# Altium schematic sheet DXES101B-659637-RELAYS.SchDoc
size A3; Organization: Altium Limited; Address1: 3 Minna Close; Address2: Belrose; Address3: NSW 2085; Address4: Australia; SheetNumber: 4; SheetTotal: 10
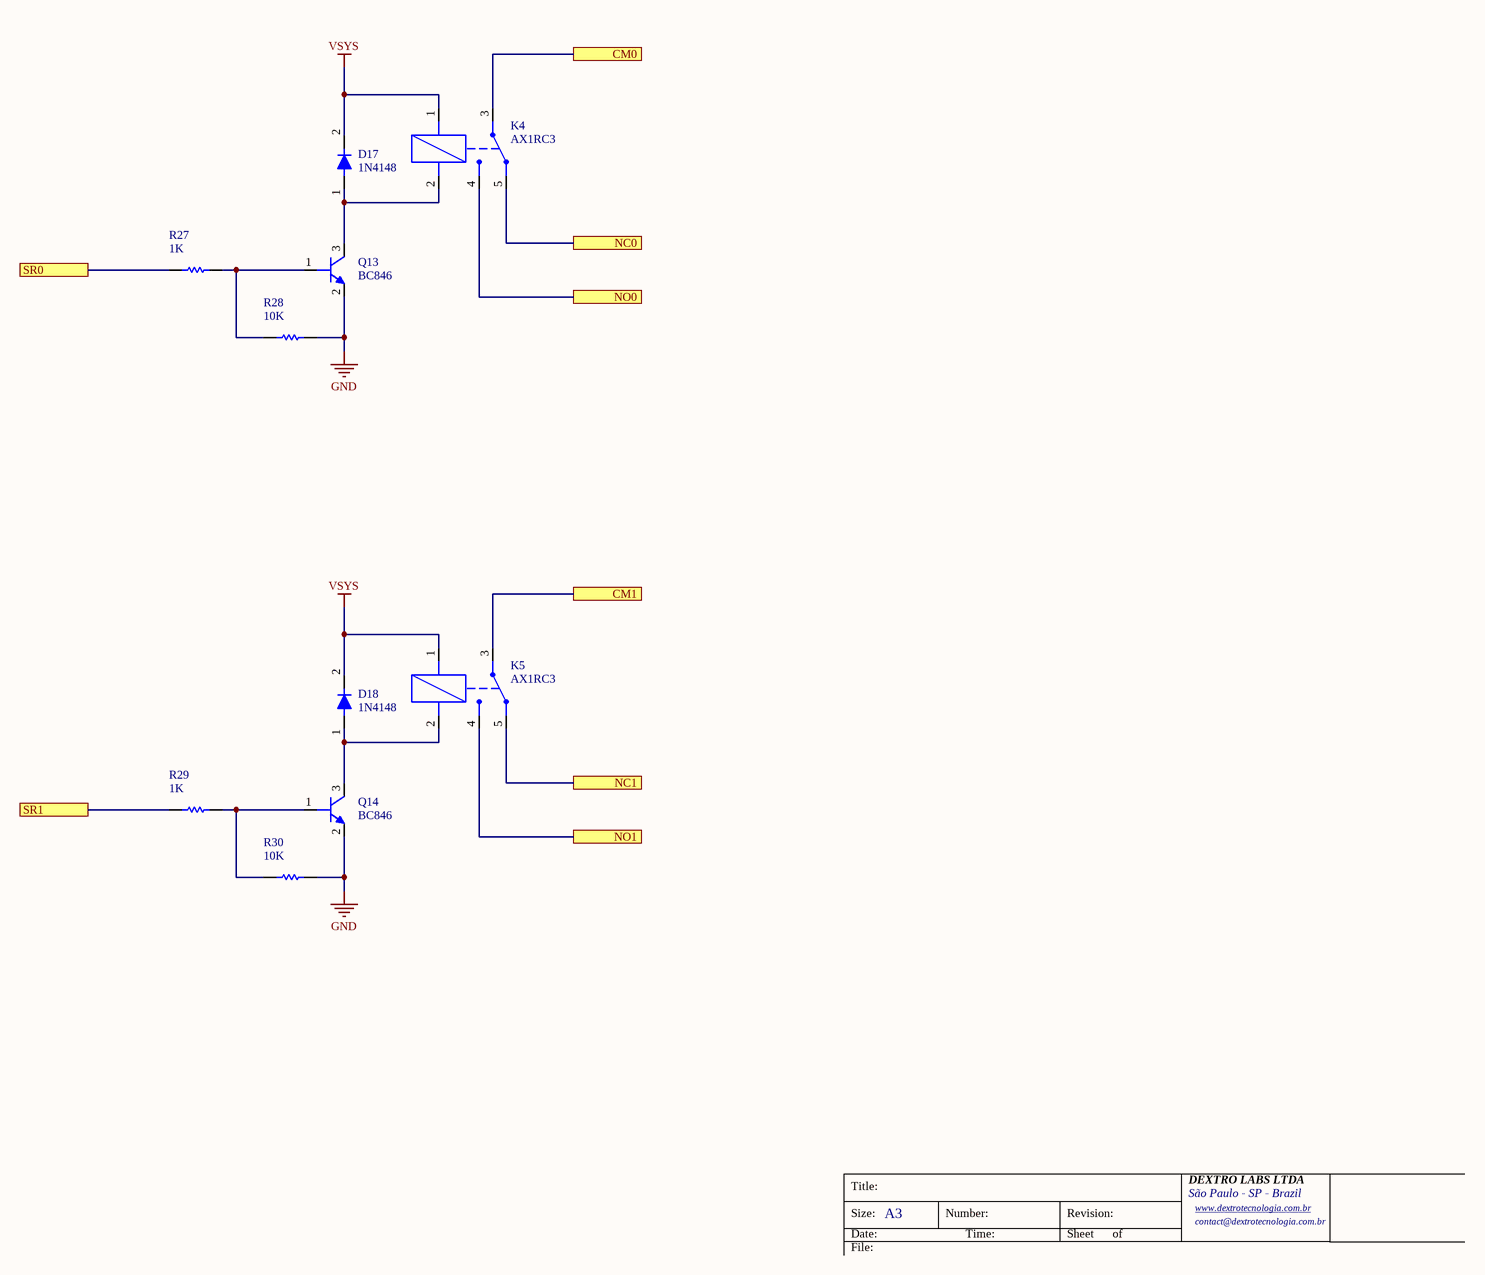
[diagram p0: DXES101B-659637-RELAYS.SchDoc]

## Parts
D17  1N4148  [SOD123]
D18  1N4148  [SOD123]
K4  AX1RC3  [AX1RCX]
K5  AX1RC3  [AX1RCX]
Q13  BC846  [SOT23-3]
Q14  BC846  [SOT23-3]
R27  1K  [RES-0603]
R28  10K  [RES-0603]
R29  1K  [RES-0603]
R30  10K  [RES-0603]

## Ports
CM0 (see DXES101B-659637-GENERAL[4A]), CM1 (see DXES101B-659637-GENERAL[4B]), NC0 (see DXES101B-659637-GENERAL[4A]), NC1 (see DXES101B-659637-GENERAL[4A]), NO0 (see DXES101B-659637-GENERAL[4A]), NO1 (see DXES101B-659637-GENERAL[4B]), SR0 (see DXES101B-659637-GENERAL[3A], DXES101B-659637-POWER-AND-SIGNALS[2C]), SR1 (see DXES101B-659637-GENERAL[3A], DXES101B-659637-POWER-AND-SIGNALS[3C])

## Nets
GND: Q13.2 Q14.2 R28.2 R30.2
VSYS: D17.2(K) D18.2(K) K4.1 K5.1
CM0: K4.3 ; port CM0
CM1: K5.3 ; port CM1
NC0: K4.5 ; port NC0
NC1: K5.5 ; port NC1
NO0: K4.4 ; port NO0
NO1: K5.4 ; port NO1
SR0: R27.1 ; port SR0
SR1: R29.1 ; port SR1
NetD17_1: D17.1(A1) K4.2 Q13.3
NetD18_1: D18.1(A1) K5.2 Q14.3
NetQ13_1: Q13.1 R27.2 R28.1
NetQ14_1: Q14.1 R29.2 R30.1

## Notes on the sheet
- Title:
- Size:
- Date:
- A3
- Number:
- Time:
- Revision:
- Sheet
- of
- DEXTRO LABS LTDA
- São Paulo - SP - Brazil
- www.dextrotecnologia.com.br <http://www.dextrotecnologia.com.br>
- contact@dextrotecnologia.com.br
- File:

## Library data of the parts
D17 D18 = 1N4148: 1A 4ns 75V Independent 1V@50mA 150mA SOD-123 Single Diodes RoHS
K4 K5 = AX1RC3: RELÉ-METALTEX-BOBINA 24V-15A-SPDT
Q13 Q14 = TRANSISTOR-BC846B,215-SOT23: 65V 200@10mA,5V 250mW 100mA NPN SOT-23 Bipolar (BJT) ROHS; LCSC: C87062
R27 R29 = RES-1K-1%-100mW-0603: 100mW Thick Film Resistor 75V ±100ppm/℃ ±1% 1kΩ 0603 Chip Resistor - Surface Mount ROHS; LCSC: C22548
R28 R30 = RES-10K-1%-100mW-0603: 100mW Thick Film Resistor 75V ±100ppm/℃ ±1% 10kΩ 0603 Chip Resistor - Surface Mount ROHS; LCSC: C98220